# Altium schematic sheet [05] - REVISION HISTORY.SchDoc
size A3; Engineer: jpnbino; DocumentNumber: 5; SheetNumber: 5; SheetTotal: 6
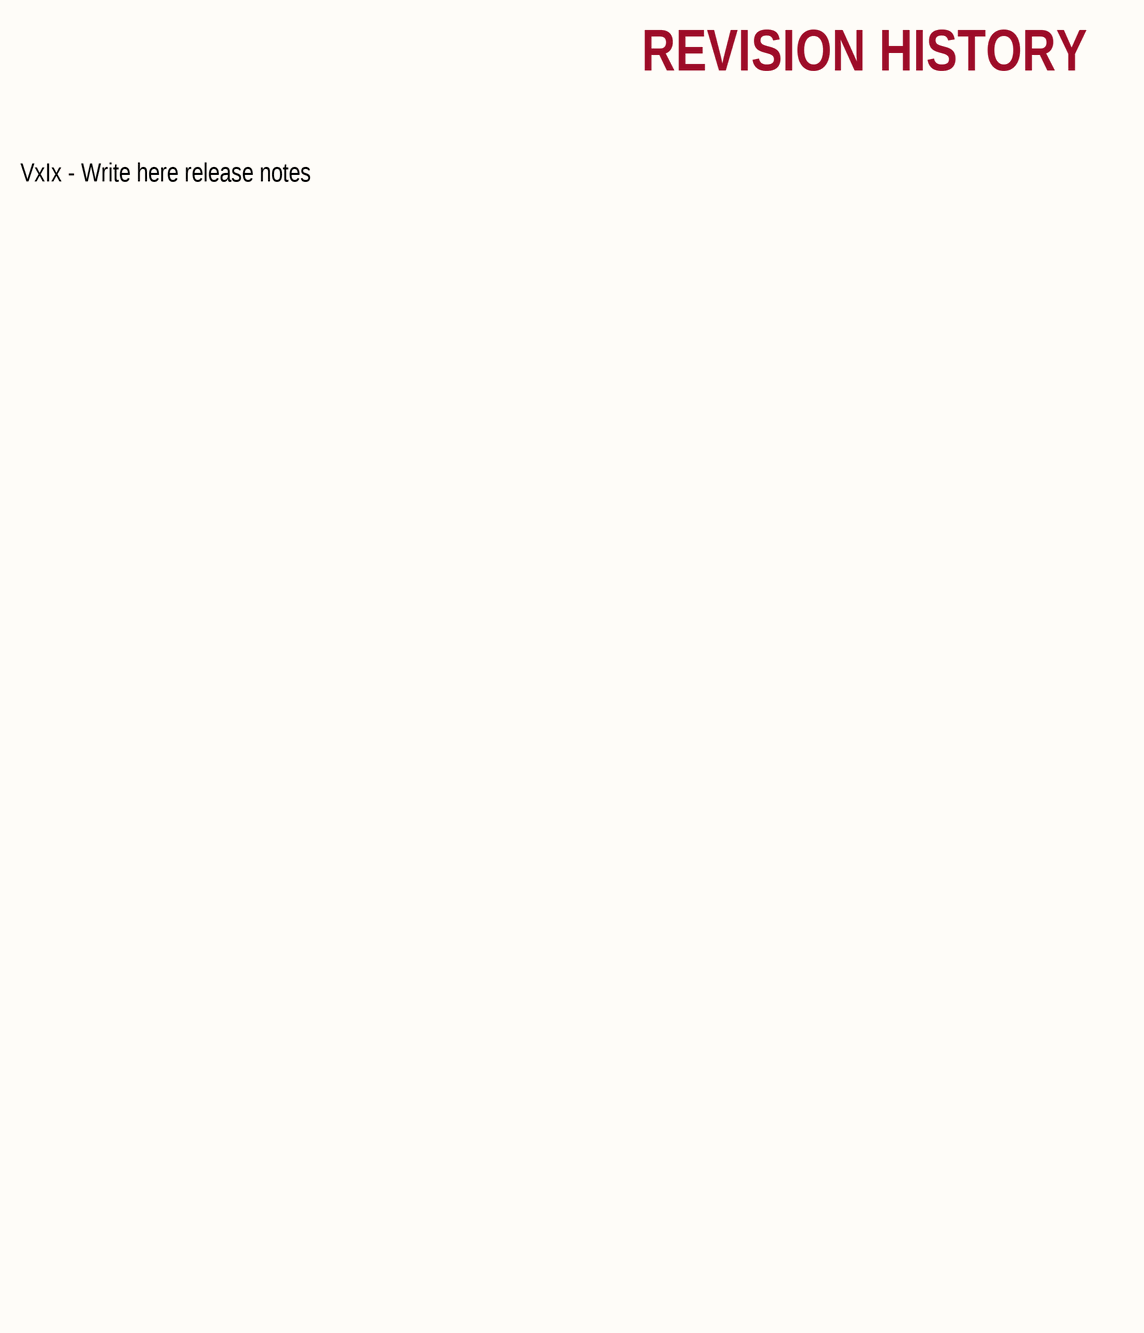
[diagram p0: [05] - REVISION HISTORY.SchDoc]

## Notes on the sheet
- REVISION HISTORY
- VxIx - Write here release notes
- CLOCKS (CPU & PCIE)
- Project:
- Revision:
- Engineer:
- Title:
- Pag
- of
- Embedded Things
- Date:
- Hour:
- Variant: